# EasyEDA Pro project MicroDuck-Hub-RevN-Cap-ECO1.epro

# Board microduck-power-hub
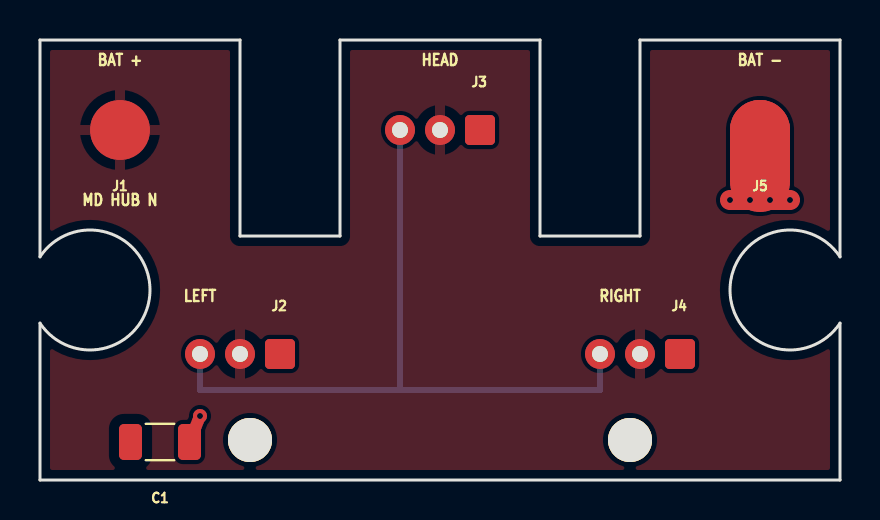
[diagram p0: board, top side]
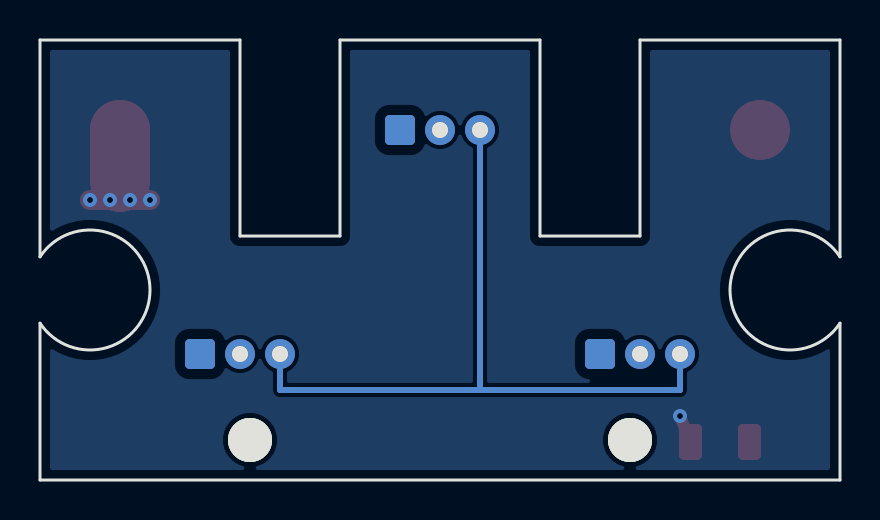
[diagram p1: board, bottom side, seen from below]

Outline 40 x 22 mm; copper layers: Top Layer, Bottom Layer. Coordinates in mm from the lower left corner of the outline.
Outline path: 0,22 10,22 10,12.2 15,12.2 15,22 25,22 25,12.2 30,12.2 30,22 40,22 40,11.16 arc(34.5,9.5) 40,7.84 40,0 0,0 0,7.84 arc(5.5,9.5) 0,11.16 0,22
Stack: Top Layer 0.0018mm / dielectric 1 0.0366mm FR4 er 4.5 / Bottom Layer 0.0018mm

## Design rules (mm)
track width GND_Input_Neck_3mm: min 0.2, default 1, max 3.2
spacing safeClearance (default): track to track 0.2, other pairs 0.2 to 0.5
net VBAT uses CopperRegion
net GND uses CopperRegion1, GND_Input_Neck_3mm
pour ie94 uses CopperRegion1
pour ie95 uses CopperRegion

## Placement (name value [footprint] x y rotation side)
C1  10uF_25V_X7R  [Capacitor_SMD:C_1206_3216Metric]  6 1.9 0 top
H1  Case_mount_clearance_2.2_thread_unverified  [footprint_a839]  10.5 2 0 top
H2  Case_mount_clearance_2.2_thread_unverified  [footprint_a839]  29.5 2 0 top
J1  BAT_PLUS_LEFT  [Hub:SolderInput_SMD_D3]  4 17.5 0 top
J2  A2007WV-3P_LEFT  [Hub:CJT_A2007WV-3P_C225336]  8 6.3 0 top
J3  A2007WV-3P_HEAD  [Hub:CJT_A2007WV-3P_C225336]  18 17.5 0 top
J4  A2007WV-3P_RIGHT  [Hub:CJT_A2007WV-3P_C225336]  28 6.3 0 top
J5  BAT_MINUS_RIGHT  [Hub:SolderInput_SMD_D3]  36 17.5 0 top

## Footprints (pads in the part's own frame, mm; a bottom-side part is the same pattern mirrored in y, then rotated)
Capacitor_SMD:C_1206_3216Metric
  custom 1.15x1.8 smd: 1(-1.475,0) 2(1.475,0)
footprint_a839
  round 2.2 hole 2.2: (0,0)
Hub:CJT_A2007WV-3P_C225336
  custom 1.5x1.5 hole 0.8: 1(4,0)
  round 1.5 hole 0.8: 2(2,0) 3(0,0)
Hub:SolderInput_SMD_D3
  round 3 smd: 1(0,0)

## Nets
GND: C1.2 J2.1 J3.1 J4.1 J5.1
VBAT: C1.1 J1.1 J2.2 J3.2 J4.2
DATA: J2.3 J3.3 J4.3

## Via types
v1: diameter 0.7, hole 0.3, Top Layer to Bottom Layer, 5 vias

## Routing (per net, layer and track width the routed paths; a pad name or vN(x,y) marks a point on that pad's centre or on a via; arc(x,y) is an arc through that point)
GND: length 7.9
  Top Layer w0.6: C1.2 v1(8,3.2)
  Top Layer w1: v1(34.5,14) v1(37.5,14) ; 36,14.9 36,14
  Top Layer w3: J5.1 36,14.9
  vias: v1(35.5,14) v1(36.5,14)
DATA: length 36.6
  Bottom Layer w0.3: J4.3 28,4.5 8,4.5 J2.3 ; J3.3 18,4.5

## Copper pours and planes (outline as drawn; the poured copper is in the pictures)
GND on Bottom Layer: 0.5,21.5 39.5,21.5 39.5,0.5 0.5,0.5
VBAT on Top Layer: 0.5,21.5 39.5,21.5 39.5,0.5 0.5,0.5

## Text on the board
Top Silkscreen Layer: BAT + | MD HUB N | LEFT | HEAD | RIGHT | BAT -
